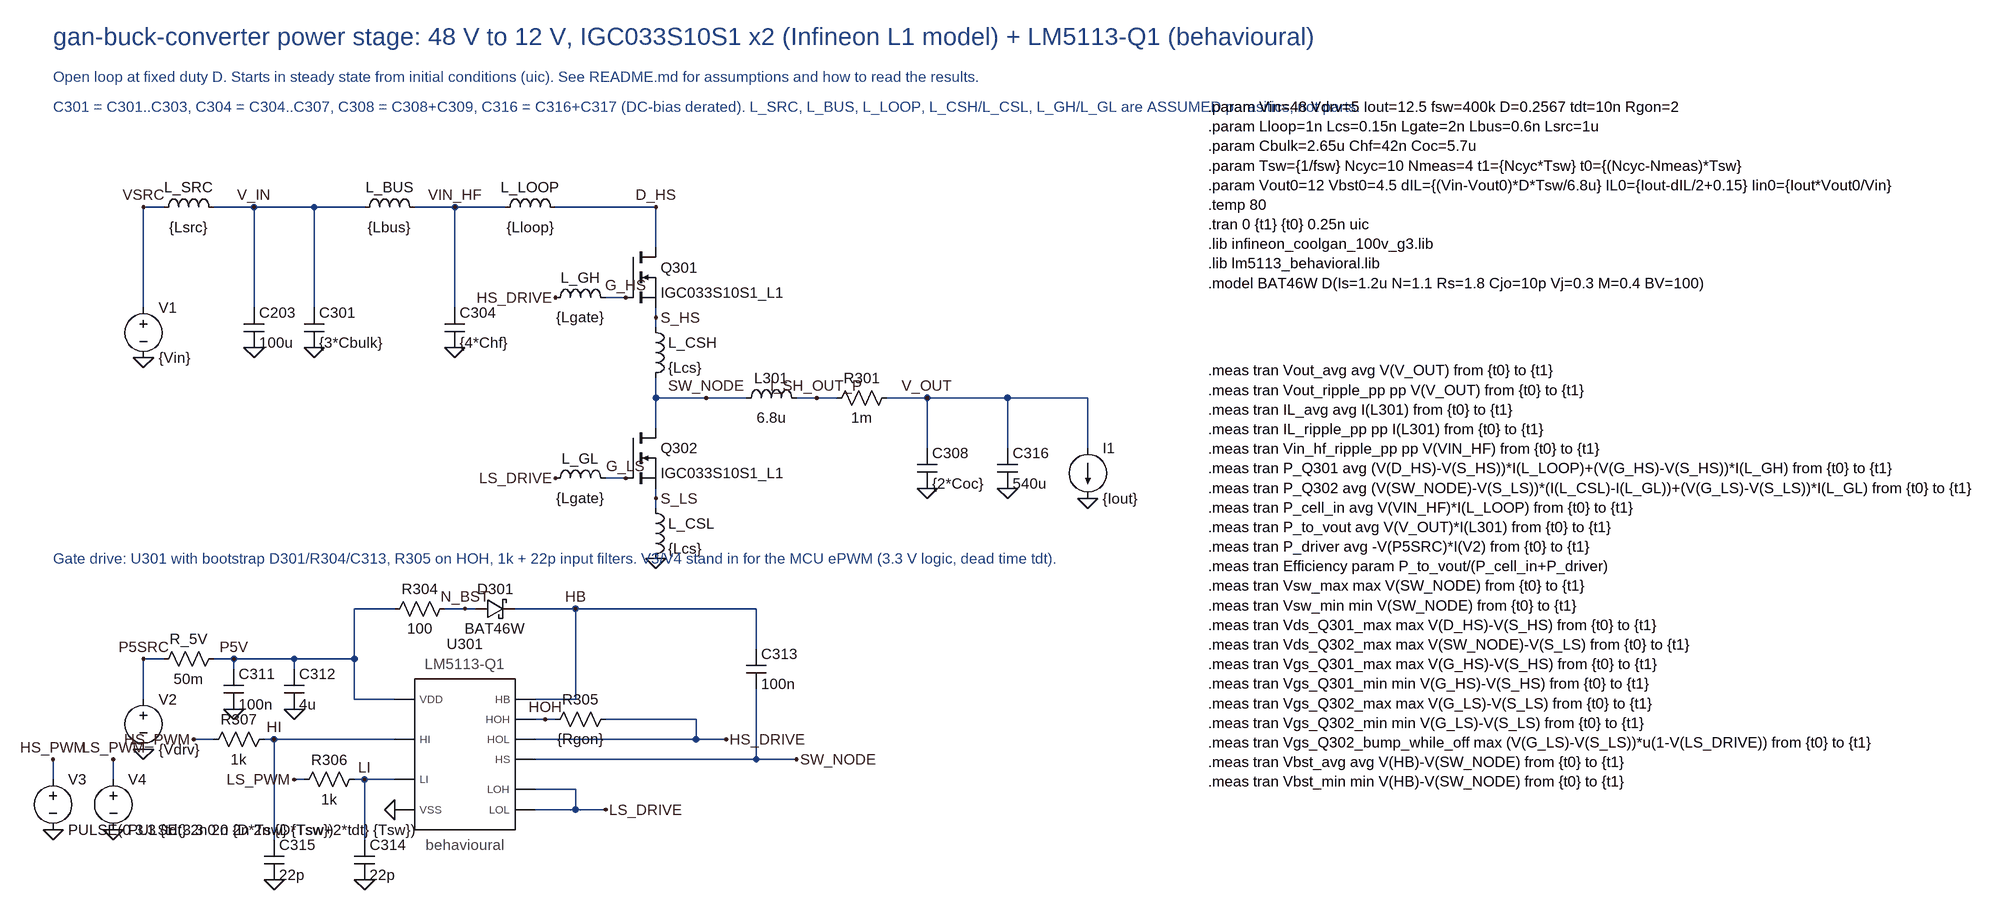
[diagram p0: schematic buck_power_stage.asc]
buck_power_stage.asc, the LTspice schematic file:
Version 4
SHEET 1 3200 1800
WIRE -992 256 -992 96
WIRE -992 96 -960 96
WIRE -880 96 -816 96
WIRE -816 96 -720 96
WIRE -816 96 -816 256
WIRE -720 96 -720 256
WIRE -720 96 -640 96
WIRE -560 96 -496 96
WIRE -496 96 -496 256
WIRE -496 96 -416 96
WIRE -336 96 -176 96
WIRE -176 96 -176 160
WIRE -176 256 -176 272
WIRE -176 272 -176 288
WIRE -176 368 -176 400
WIRE -176 400 -176 448
WIRE -176 544 -176 560
WIRE -176 560 -176 576
WIRE -256 240 -224 240
WIRE -256 528 -224 528
WIRE 192 400 256 400
WIRE 256 400 256 480
WIRE 256 400 384 400
WIRE 384 400 384 480
WIRE 384 400 512 400
WIRE 512 400 512 480
WIRE -992 880 -992 816
WIRE -992 816 -960 816
WIRE -880 816 -848 816
WIRE -848 816 -848 832
WIRE -848 816 -752 816
WIRE -752 816 -752 832
WIRE -752 816 -656 816
WIRE -656 816 -656 880
WIRE -656 880 -592 880
WIRE -656 816 -656 736
WIRE -656 736 -592 736
WIRE -400 736 -304 736
WIRE -304 736 -304 880
WIRE -304 880 -368 880
WIRE -304 736 -16 736
WIRE -16 736 -16 800
WIRE -368 976 -16 976
WIRE -16 976 -16 864
WIRE -16 976 48 976
WIRE -256 912 -112 912
WIRE -112 912 -112 944
WIRE -368 944 -112 944
WIRE -112 944 -64 944
WIRE -368 1024 -304 1024
WIRE -304 1024 -304 1056
WIRE -368 1056 -304 1056
WIRE -304 1056 -256 1056
WIRE -1136 1008 -1136 976
WIRE -912 944 -880 944
WIRE -800 944 -784 944
WIRE -784 944 -784 1104
WIRE -784 944 -592 944
WIRE -1040 1008 -1040 976
WIRE -752 1008 -736 1008
WIRE -656 1008 -640 1008
WIRE -640 1008 -640 1104
WIRE -640 1008 -592 1008
WIRE -176 400 -96 400
WIRE -96 400 -32 400
WIRE 48 400 80 400
WIRE 80 400 112 400
WIRE -512 736 -480 736
WIRE -480 736 -464 736
WIRE -368 912 -352 912
WIRE -352 912 -336 912
FLAG -992 336 0
FLAG -992 96 VSRC
FLAG -816 96 V_IN
FLAG -816 320 0
FLAG -720 320 0
FLAG -496 96 VIN_HF
FLAG -496 320 0
FLAG -176 96 D_HS
FLAG -176 272 S_HS
FLAG -176 560 S_LS
FLAG -176 656 0
FLAG -336 240 HS_DRIVE
FLAG -224 240 G_HS
FLAG -336 528 LS_DRIVE
FLAG -224 528 G_LS
FLAG -96 400 SW_NODE
FLAG 80 400 I_SH_OUT_P
FLAG 256 400 V_OUT
FLAG 256 544 0
FLAG 384 544 0
FLAG 512 560 0
FLAG -992 960 0
FLAG -992 816 P5SRC
FLAG -848 816 P5V
FLAG -848 896 0
FLAG -752 896 0
FLAG -480 736 N_BST
FLAG -304 736 HB
FLAG 48 976 SW_NODE
FLAG -352 912 HOH
FLAG -64 944 HS_DRIVE
FLAG -256 1056 LS_DRIVE
FLAG -592 1056 0
FLAG -1136 1088 0
FLAG -1136 976 HS_PWM
FLAG -912 944 HS_PWM
FLAG -784 1168 0
FLAG -784 944 HI
FLAG -1040 1088 0
FLAG -1040 976 LS_PWM
FLAG -752 1008 LS_PWM
FLAG -640 1168 0
FLAG -640 1008 LI
SYMBOL voltage -992 240 R0
SYMATTR InstName V1
SYMATTR Value {Vin}
SYMBOL ind -976 112 R270
WINDOW 0 32 56 VTop 2
WINDOW 3 0 56 VBottom 2
SYMATTR InstName L_SRC
SYMATTR Value {Lsrc}
SYMATTR SpiceLine Rser=20m ic={Iin0}
SYMBOL cap -832 256 R0
SYMATTR InstName C203
SYMATTR Value 100u
SYMATTR SpiceLine Rser=0.32 ic={Vin}
SYMBOL cap -736 256 R0
SYMATTR InstName C301
SYMATTR Value {3*Cbulk}
SYMATTR SpiceLine Rser=1m Lser=0.25n ic={Vin}
SYMBOL ind -656 112 R270
WINDOW 0 32 56 VTop 2
WINDOW 3 0 56 VBottom 2
SYMATTR InstName L_BUS
SYMATTR Value {Lbus}
SYMBOL cap -512 256 R0
SYMATTR InstName C304
SYMATTR Value {4*Chf}
SYMATTR SpiceLine Rser=5m ic={Vin}
SYMBOL ind -432 112 R270
WINDOW 0 32 56 VTop 2
WINDOW 3 0 56 VBottom 2
SYMATTR InstName L_LOOP
SYMATTR Value {Lloop}
SYMBOL nmos -224 160 R0
SYMATTR InstName Q301
SYMATTR Value IGC033S10S1_L1
SYMATTR Prefix X
SYMBOL ind -192 272 R0
SYMATTR InstName L_CSH
SYMATTR Value {Lcs}
SYMBOL nmos -224 448 R0
SYMATTR InstName Q302
SYMATTR Value IGC033S10S1_L1
SYMATTR Prefix X
SYMBOL ind -192 560 R0
SYMATTR InstName L_CSL
SYMATTR Value {Lcs}
SYMBOL ind -352 256 R270
WINDOW 0 32 56 VTop 2
WINDOW 3 0 56 VBottom 2
SYMATTR InstName L_GH
SYMATTR Value {Lgate}
SYMBOL ind -352 544 R270
WINDOW 0 32 56 VTop 2
WINDOW 3 0 56 VBottom 2
SYMATTR InstName L_GL
SYMATTR Value {Lgate}
SYMBOL ind -48 416 R270
WINDOW 0 32 56 VTop 2
WINDOW 3 0 56 VBottom 2
SYMATTR InstName L301
SYMATTR Value 6.8u
SYMATTR SpiceLine Rser=2.1m ic={IL0}
SYMBOL res 96 416 R270
WINDOW 0 32 56 VTop 2
WINDOW 3 0 56 VBottom 2
SYMATTR InstName R301
SYMATTR Value 1m
SYMBOL cap 240 480 R0
SYMATTR InstName C308
SYMATTR Value {2*Coc}
SYMATTR SpiceLine Rser=2.5m Lser=0.3n ic={Vout0}
SYMBOL cap 368 480 R0
SYMATTR InstName C316
SYMATTR Value 540u
SYMATTR SpiceLine Rser=5m Lser=1.5n ic={Vout0}
SYMBOL current 512 480 R0
SYMATTR InstName I1
SYMATTR Value {Iout}
SYMBOL LM5113_BEHAV -480 960 R0
SYMATTR InstName U301
SYMATTR Value LM5113_BEHAV
SYMBOL voltage -992 864 R0
SYMATTR InstName V2
SYMATTR Value {Vdrv}
SYMBOL res -976 832 R270
WINDOW 0 32 56 VTop 2
WINDOW 3 0 56 VBottom 2
SYMATTR InstName R_5V
SYMATTR Value 50m
SYMBOL cap -864 832 R0
SYMATTR InstName C311
SYMATTR Value 100n
SYMATTR SpiceLine ic={Vdrv}
SYMBOL cap -768 832 R0
SYMATTR InstName C312
SYMATTR Value 4u
SYMATTR SpiceLine Rser=5m ic={Vdrv}
SYMBOL res -608 752 R270
WINDOW 0 32 56 VTop 2
WINDOW 3 0 56 VBottom 2
SYMATTR InstName R304
SYMATTR Value 100
SYMBOL schottky -464 752 R270
WINDOW 0 32 32 VTop 2
WINDOW 3 0 32 VBottom 2
SYMATTR InstName D301
SYMATTR Value BAT46W
SYMBOL cap -32 800 R0
SYMATTR InstName C313
SYMATTR Value 100n
SYMATTR SpiceLine ic={Vbst0}
SYMBOL res -352 928 R270
WINDOW 0 32 56 VTop 2
WINDOW 3 0 56 VBottom 2
SYMATTR InstName R305
SYMATTR Value {Rgon}
SYMBOL voltage -1136 992 R0
SYMATTR InstName V3
SYMATTR Value PULSE(0 3.3 {tdt} 2n 2n {D*Tsw} {Tsw})
SYMBOL res -896 960 R270
WINDOW 0 32 56 VTop 2
WINDOW 3 0 56 VBottom 2
SYMATTR InstName R307
SYMATTR Value 1k
SYMBOL cap -800 1104 R0
SYMATTR InstName C315
SYMATTR Value 22p
SYMBOL voltage -1040 992 R0
SYMATTR InstName V4
SYMATTR Value PULSE(3.3 0 0 2n 2n {D*Tsw+2*tdt} {Tsw})
SYMBOL res -752 1024 R270
WINDOW 0 32 56 VTop 2
WINDOW 3 0 56 VBottom 2
SYMATTR InstName R306
SYMATTR Value 1k
SYMBOL cap -656 1104 R0
SYMATTR InstName C314
SYMATTR Value 22p
SYMATTR SpiceLine ic=3.3
TEXT -1136 -176 Left 4 ;gan-buck-converter power stage: 48 V to 12 V, IGC033S10S1 x2 (Infineon L1 model) + LM5113-Q1 (behavioural)
TEXT -1136 -112 Left 2 ;Open loop at fixed duty D. Starts in steady state from initial conditions (uic). See README.md for assumptions and how to read the results.
TEXT -1136 -64 Left 2 ;C301 = C301..C303, C304 = C304..C307, C308 = C308+C309, C316 = C316+C317 (DC-bias derated). L_SRC, L_BUS, L_LOOP, L_CSH/L_CSL, L_GH/L_GL are ASSUMED parasitics, not parts.
TEXT -1136 656 Left 2 ;Gate drive: U301 with bootstrap D301/R304/C313, R305 on HOH, 1k + 22p input filters. V3/V4 stand in for the MCU ePWM (3.3 V logic, dead time tdt).
TEXT 704 -64 Left 2 !.param Vin=48 Vdrv=5 Iout=12.5 fsw=400k D=0.2567 tdt=10n Rgon=2\n.param Lloop=1n Lcs=0.15n Lgate=2n Lbus=0.6n Lsrc=1u\n.param Cbulk=2.65u Chf=42n Coc=5.7u\n.param Tsw={1/fsw} Ncyc=10 Nmeas=4 t1={Ncyc*Tsw} t0={(Ncyc-Nmeas)*Tsw}\n.param Vout0=12 Vbst0=4.5 dIL={(Vin-Vout0)*D*Tsw/6.8u} IL0={Iout-dIL/2+0.15} Iin0={Iout*Vout0/Vin}\n.temp 80\n.tran 0 {t1} {t0} 0.25n uic\n.lib infineon_coolgan_100v_g3.lib\n.lib lm5113_behavioral.lib\n.model BAT46W D(Is=1.2u N=1.1 Rs=1.8 Cjo=10p Vj=0.3 M=0.4 BV=100)
TEXT 704 356 Left 2 !.meas tran Vout_avg avg V(V_OUT) from {t0} to {t1}\n.meas tran Vout_ripple_pp pp V(V_OUT) from {t0} to {t1}\n.meas tran IL_avg avg I(L301) from {t0} to {t1}\n.meas tran IL_ripple_pp pp I(L301) from {t0} to {t1}\n.meas tran Vin_hf_ripple_pp pp V(VIN_HF) from {t0} to {t1}\n.meas tran P_Q301 avg (V(D_HS)-V(S_HS))*I(L_LOOP)+(V(G_HS)-V(S_HS))*I(L_GH) from {t0} to {t1}\n.meas tran P_Q302 avg (V(SW_NODE)-V(S_LS))*(I(L_CSL)-I(L_GL))+(V(G_LS)-V(S_LS))*I(L_GL) from {t0} to {t1}\n.meas tran P_cell_in avg V(VIN_HF)*I(L_LOOP) from {t0} to {t1}\n.meas tran P_to_vout avg V(V_OUT)*I(L301) from {t0} to {t1}\n.meas tran P_driver avg -V(P5SRC)*I(V2) from {t0} to {t1}\n.meas tran Efficiency param P_to_vout/(P_cell_in+P_driver)\n.meas tran Vsw_max max V(SW_NODE) from {t0} to {t1}\n.meas tran Vsw_min min V(SW_NODE) from {t0} to {t1}\n.meas tran Vds_Q301_max max V(D_HS)-V(S_HS) from {t0} to {t1}\n.meas tran Vds_Q302_max max V(SW_NODE)-V(S_LS) from {t0} to {t1}\n.meas tran Vgs_Q301_max max V(G_HS)-V(S_HS) from {t0} to {t1}\n.meas tran Vgs_Q301_min min V(G_HS)-V(S_HS) from {t0} to {t1}\n.meas tran Vgs_Q302_max max V(G_LS)-V(S_LS) from {t0} to {t1}\n.meas tran Vgs_Q302_min min V(G_LS)-V(S_LS) from {t0} to {t1}\n.meas tran Vgs_Q302_bump_while_off max (V(G_LS)-V(S_LS))*u(1-V(LS_DRIVE)) from {t0} to {t1}\n.meas tran Vbst_avg avg V(HB)-V(SW_NODE) from {t0} to {t1}\n.meas tran Vbst_min min V(HB)-V(SW_NODE) from {t0} to {t1}

The netlist it stands for:
* buck_power_stage.asc
V1 VSRC 0 {Vin}
L_SRC VSRC V_IN {Lsrc} Rser=20m ic={Iin0}
C203 V_IN 0 100u Rser=0.32 ic={Vin}
C301 V_IN 0 {3*Cbulk} Rser=1m Lser=0.25n ic={Vin}
L_BUS V_IN VIN_HF {Lbus}
C304 VIN_HF 0 {4*Chf} Rser=5m ic={Vin}
L_LOOP VIN_HF D_HS {Lloop}
XQ301 D_HS G_HS S_HS IGC033S10S1_L1  ; pins D G S
L_CSH S_HS SW_NODE {Lcs}
XQ302 SW_NODE G_LS S_LS IGC033S10S1_L1  ; pins D G S
L_CSL S_LS 0 {Lcs}
L_GH HS_DRIVE G_HS {Lgate}
L_GL LS_DRIVE G_LS {Lgate}
L301 SW_NODE I_SH_OUT_P 6.8u Rser=2.1m ic={IL0}
R301 I_SH_OUT_P V_OUT 1m
C308 V_OUT 0 {2*Coc} Rser=2.5m Lser=0.3n ic={Vout0}
C316 V_OUT 0 540u Rser=5m Lser=1.5n ic={Vout0}
I1 V_OUT 0 {Iout}
XU301 P5V HB HOH HS_DRIVE SW_NODE HI LI 0 LS_DRIVE LS_DRIVE LM5113_BEHAV  ; pins VDD HB HOH HOL HS HI LI VSS LOH LOL
V2 P5SRC 0 {Vdrv}
R_5V P5SRC P5V 50m
C311 P5V 0 100n ic={Vdrv}
C312 P5V 0 4u Rser=5m ic={Vdrv}
R304 P5V N_BST 100
D301 N_BST HB BAT46W
C313 HB SW_NODE 100n ic={Vbst0}
R305 HOH HS_DRIVE {Rgon}
V3 HS_PWM 0 PULSE(0 3.3 {tdt} 2n 2n {D*Tsw} {Tsw})
R307 HS_PWM HI 1k
C315 HI 0 22p
V4 LS_PWM 0 PULSE(3.3 0 0 2n 2n {D*Tsw+2*tdt} {Tsw})
R306 LS_PWM LI 1k
C314 LI 0 22p ic=3.3
.model D D
.lib standard.dio
* gan-buck-converter power stage: 48 V to 12 V, IGC033S10S1 x2 (Infineon L1 model) + LM5113-Q1 (behavioural)
* Open loop at fixed duty D. Starts in steady state from initial conditions (uic). See README.md for assumptions and how to read the results.
* C301 = C301..C303, C304 = C304..C307, C308 = C308+C309, C316 = C316+C317 (DC-bias derated). L_SRC, L_BUS, L_LOOP, L_CSH/L_CSL, L_GH/L_GL are ASSUMED parasitics, not parts.
* Gate drive: U301 with bootstrap D301/R304/C313, R305 on HOH, 1k + 22p input filters. V3/V4 stand in for the MCU ePWM (3.3 V logic, dead time tdt).
.param Vin=48 Vdrv=5 Iout=12.5 fsw=400k D=0.2567 tdt=10n Rgon=2
.param Lloop=1n Lcs=0.15n Lgate=2n Lbus=0.6n Lsrc=1u
.param Cbulk=2.65u Chf=42n Coc=5.7u
.param Tsw={1/fsw} Ncyc=10 Nmeas=4 t1={Ncyc*Tsw} t0={(Ncyc-Nmeas)*Tsw}
.param Vout0=12 Vbst0=4.5 dIL={(Vin-Vout0)*D*Tsw/6.8u} IL0={Iout-dIL/2+0.15} Iin0={Iout*Vout0/Vin}
.temp 80
.tran 0 {t1} {t0} 0.25n uic
.lib infineon_coolgan_100v_g3.lib
.lib lm5113_behavioral.lib
.model BAT46W D(Is=1.2u N=1.1 Rs=1.8 Cjo=10p Vj=0.3 M=0.4 BV=100)
.meas tran Vout_avg avg V(V_OUT) from {t0} to {t1}
.meas tran Vout_ripple_pp pp V(V_OUT) from {t0} to {t1}
.meas tran IL_avg avg I(L301) from {t0} to {t1}
.meas tran IL_ripple_pp pp I(L301) from {t0} to {t1}
.meas tran Vin_hf_ripple_pp pp V(VIN_HF) from {t0} to {t1}
.meas tran P_Q301 avg (V(D_HS)-V(S_HS))*I(L_LOOP)+(V(G_HS)-V(S_HS))*I(L_GH) from {t0} to {t1}
.meas tran P_Q302 avg (V(SW_NODE)-V(S_LS))*(I(L_CSL)-I(L_GL))+(V(G_LS)-V(S_LS))*I(L_GL) from {t0} to {t1}
.meas tran P_cell_in avg V(VIN_HF)*I(L_LOOP) from {t0} to {t1}
.meas tran P_to_vout avg V(V_OUT)*I(L301) from {t0} to {t1}
.meas tran P_driver avg -V(P5SRC)*I(V2) from {t0} to {t1}
.meas tran Efficiency param P_to_vout/(P_cell_in+P_driver)
.meas tran Vsw_max max V(SW_NODE) from {t0} to {t1}
.meas tran Vsw_min min V(SW_NODE) from {t0} to {t1}
.meas tran Vds_Q301_max max V(D_HS)-V(S_HS) from {t0} to {t1}
.meas tran Vds_Q302_max max V(SW_NODE)-V(S_LS) from {t0} to {t1}
.meas tran Vgs_Q301_max max V(G_HS)-V(S_HS) from {t0} to {t1}
.meas tran Vgs_Q301_min min V(G_HS)-V(S_HS) from {t0} to {t1}
.meas tran Vgs_Q302_max max V(G_LS)-V(S_LS) from {t0} to {t1}
.meas tran Vgs_Q302_min min V(G_LS)-V(S_LS) from {t0} to {t1}
.meas tran Vgs_Q302_bump_while_off max (V(G_LS)-V(S_LS))*u(1-V(LS_DRIVE)) from {t0} to {t1}
.meas tran Vbst_avg avg V(HB)-V(SW_NODE) from {t0} to {t1}
.meas tran Vbst_min min V(HB)-V(SW_NODE) from {t0} to {t1}
.backanno
.end